# Altium schematic sheet SFP1.SchDoc: SFP1
size A3; Organization: Altium Limited; Address1: L3, 12a Rodborough Rd; Address2: Frenchs Forest; Address3: NSW; Address4: Australia 2086
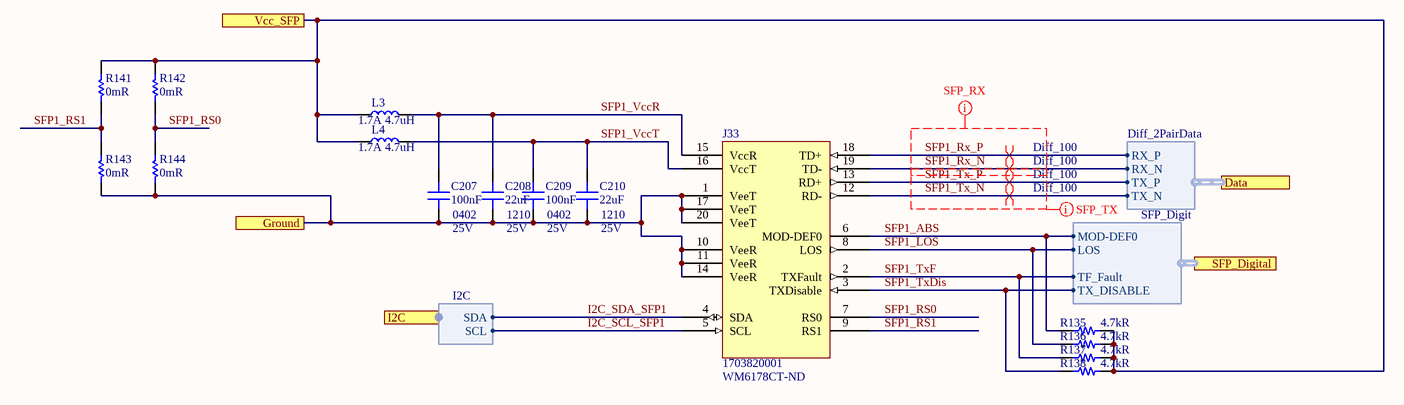
[diagram p0: SFP1.SchDoc]

## Parts
C207  100nF  Case/Package: 0402  Voltage Rating: 25V  [CAP 0402/1005 KK]
C208  22uF  Case/Package: 1210  Voltage Rating: 25V  [CAP 1210/3225 - 1MM]
C209  100nF  Case/Package: 0402  Voltage Rating: 25V  [CAP 0402/1005 KK]
C210  22uF  Case/Package: 1210  Voltage Rating: 25V  [CAP 1210/3225 - 1MM]
J33  1703820001  Supplier Part Number 1: WM6178CT-ND  [1703820001]
L3  Inductance: 4.7uH  Current Rating: 1.7A  [NRS8040]  (hidden comment: NRS4018T4R7MDGJV)
L4  Inductance: 4.7uH  Current Rating: 1.7A  [NRS8040]  (hidden comment: NRS4018T4R7MDGJV)
R135  4.7kR  [RES 0402/1005 RF KK]
R136  4.7kR  [RES 0402/1005 RF KK]
R137  4.7kR  [RES 0402/1005 RF KK]
R138  4.7kR  [RES 0402/1005 RF KK]
R141  0mR  [RES 0402/1005 RF KK]
R142  0mR  [RES 0402/1005 RF KK]
R143  0mR  [RES 0402/1005 RF KK]
R144  0mR  [RES 0402/1005 RF KK]

## Ports
Data (harness Diff_2PairData), Ground, I2C (harness I2C), SFP_Digital (harness SFP_Digit), Vcc_SFP

## Harnesses
I2C: SDA, SCL
SFP_Digit: MOD-DEF0, LOS, TF_Fault, TX_DISABLE
Diff_2PairData: RX_P, RX_N, TX_P, TX_N

## Nets
Ground: C207.1 C208.2 C209.1 C210.2 J33.1(VeeT) J33.10(VeeR) J33.11(VeeR) J33.14(VeeR) J33.17(VeeT) J33.20(VeeT) R143.2 R144.2 ; port Ground
I2C_SCL_SFP1: J33.5(SCL) ; port I2C.SCL
I2C_SDA_SFP1: J33.4(SDA) ; port I2C.SDA
SFP1_ABS: J33.6(MOD-DEF0) R135.1 ; port SFP_Digital.MOD-DEF0
SFP1_LOS: J33.8(LOS) R136.1 ; port SFP_Digital.LOS
SFP1_RS0: J33.7(RS0) R142.2 R144.1
SFP1_RS1: J33.9(RS1) R141.2 R143.1
SFP1_Rx_N: J33.19(TD-) ; port Data.RX_N
SFP1_Rx_P: J33.18(TD+) ; port Data.RX_P
SFP1_Tx_N: J33.12(RD-) ; port Data.TX_N
SFP1_Tx_P: J33.13(RD+) ; port Data.TX_P
SFP1_TxDis: J33.3(TXDisable) R138.1 ; port SFP_Digital.TX_DISABLE
SFP1_TxF: J33.2(TXFault) R137.1 ; port SFP_Digital.TF_Fault
SFP1_VccR: C207.2 C208.1 J33.15(VccR) L3.2
SFP1_VccT: C209.2 C210.1 J33.16(VccT) L4.2
Vcc_SFP: L3.1 L4.1 R135.2 R136.2 R137.2 R138.2 R141.1 R142.1 ; port Vcc_SFP

## Layout directives
differential pair; differential pair class Diff_100: SFP1_Rx_N, SFP1_Rx_P, SFP1_Tx_N, SFP1_Tx_P
net class SFP_RX: SFP1_Rx_N, SFP1_Rx_P
net class SFP_TX: SFP1_Rx_N, SFP1_Tx_N, SFP1_Tx_P

## Notes on the sheet
- Title
- Size:
- Date:
- A3
- Number:
- Time:
- Revision:
- Sheet
- of
- File:

## Library data of the parts
C207 C209 = Capacitor: Manufacturer: Murata; Manufacturer Part Number: GRM155R71E104KE14J; Tolerance: 10%; Dielectric: X7R; Supplier 1: Digi-Key; Supplier Part Number 1: 490-14603-1-ND; Stock 1: 89275; Pricing 1: 1 = 0,10000, 10 = 0,03400, 100 = 0,01520, 500 = 0,01088, 1000 = 0,00855, 2500 = 0,00778, 5000 = 0,00715 (USD); RoHS: Yes; Mount: Surface Mount; Weight: 0.000212oz; Case Code (Imperial): 0402; Case Code (Metric): 1005; Min Operating Temperature: -55°C; Max Operating Temperature: 125°C; Packaging: Tape and Reel; Capacitance: 100nF; Termination: SMD/SMT; Composition: Ceramic; Voltage Rating (DC): 25V; Package Quantity: 50000; Length: 0.039inch; Height: 0.5mm; Width: 0.5mm; Thickness: 0.022inch; ComponentLink1URL: http://www.mouser.com/ds/2/281/c02e-2905.pdf?src-supplier=Mouser; ComponentLink1Description: http://www.mouser.com/ds/2/281/c02e-2905.pdf?src-supplier=Mouser; ComponentLink2URL: http://search.murata.co.jp/Ceramy/image/img/A01X/G101/ENG/GRM155R71E104KE14-01.pdf?src-supplier=Digi-Key; ComponentLink2Description: http://search.murata.co.jp/Ceramy/image/img/A01X/G101/ENG/GRM155R71E104KE14-01.pdf?src-supplier=Digi-Key
C208 C210 = Capacitor: Manufacturer: Samsung; Manufacturer Part Number: CL32A226KAJNNNE; Material: Ceramic; Tolerance: 10%; Dielectric: X5R; Supplier 1: Digi-Key; Supplier Part Number 1: 1276-1101-1-ND; Stock 1: 46396; Pricing 1: 1 = 0,51000, 10 = 0,36300, 100 = 0,23920, 500 = 0,17722 (USD); RoHS: Yes; Mount: Surface Mount; Case Code (Metric): 3225; Case Code (Imperial): 1210; Contact Plating: Tin; Min Operating Temperature: -55°C; Max Operating Temperature: 85°C; Capacitance: 22uF; Packaging: Tape and Reel; Package Quantity: 1; Voltage: 25V; Length: 3.2mm; Height: 2.5mm; Width: 0.098inch; Thickness: 0.106inch; Depth: 2.5mm; Radiation Hardening: No; ComponentLink1URL: https://datasheet.ciiva.com/26947/getdatasheetpartid-358377-26947025.pdf?src-supplier=Verical; ComponentLink1Description: https://datasheet.ciiva.com/26947/getdatasheetpartid-358377-26947025.pdf?src-supplier=Verical; ComponentLink2URL: https://datasheet.ciiva.com/16202/cl32a226kajnnne-16202745.pdf?src-supplier=Future+Electronics; ComponentLink2Description: https://datasheet.ciiva.com/16202/cl32a226kajnnne-16202745.pdf?src-supplier=Future+Electronics; ComponentLink3URL: https://datasheet.ciiva.com/29241/450711-da-01-en-vs-kondensator-1210-29241799.pdf?src-supplier=Conrad; ComponentLink3Description: https://datasheet.ciiva.com/29241/450711-da-01-en-vs-kondensator-1210-29241799.pdf?src-supplier=Conrad
J33 = 1703820001: Conn zSFP+ F 20 POS 0.8mm Solder RA SMD 20 Terminal 1 Port zSFP+™ Reel; Manufacturer: Molex; Number of Circuits: 20; Connector Type: Receptacle; Number of Ports: 1; Max Voltage Rating (AC): 120V; Gender: Female; Current Rating: 500mA; Supplier 1: Digi-Key; Manufacturer Part Number: 1703820001; RoHS: Yes; Category: Connectors; Stock 1: 248; Pricing 1: 1=2,23000, 10=2,02500, 25=1,90080, 50=1,81820, 100=1,73550 (USD); Mount: Surface Mount; Material: Brass; Contact Plating: Gold; Contact Material: Bronze,Brass,Copper Alloy; Housing Material: Polycarbonate; Housing Color: Black; Min Operating Temperature: -40°C; Max Operating Temperature: 85°C; Number of Positions: 20; Termination: Solder; Number of Positions Loaded: 20; Package Quantity: 960; Number of Contacts: 20; Packaging: Tape and Reel; Max Voltage Rating (DC): 120V; Voltage Rating (AC): 120V; Orientation: Right Angle; Length: 11mm; Pitch: 0.8mm; Depth: 7.87mm; Radiation Hardening: No; REACH SVHC: No SVHC; Halogen Free: Low Halogen; ELV: Compliant; Flammability Rating: UL94 V-0; ComponentLink1URL: https://datasheet.ciiva.com/3966/317371703820001-io-nectors-3966818.pdf?src-supplier=Arrow; ComponentLink1Description: https://datasheet.ciiva.com/3966/317371703820001-io-nectors-3966818.pdf?src-supplier=Arrow; ComponentLink2URL: https://datasheet.ciiva.com/26288/495951703820001-io-nectors-26288395.pdf?src-supplier=Onlinecomponents.com; ComponentLink2Description: https://datasheet.ciiva.com/26288/495951703820001-io-nectors-26288395.pdf?src-supplier=Onlinecomponents.com; ComponentLink3URL: https://datasheet.ciiva.com/26945/getdatasheetpartid-750999-26945324.pdf?src-supplier=Verical; ComponentLink3Description: https://datasheet.ciiva.com/26945/getdatasheetpartid-750999-26945324.pdf?src-supplier=Verical; ComponentLink4URL: https://datasheet.ciiva.com/16077/629941703820001-io-nectors-16077135.pdf?src-supplier=Onlinecomponents.com; ComponentLink4Description: https://datasheet.ciiva.com/16077/629941703820001-io-nectors-16077135.pdf?src-supplier=Onlinecomponents.com; ComponentLink5URL: https://datasheet.ciiva.com/6929/1703820001-sd-6929267.pdf?src-supplier=Digi-Key; ComponentLink5Description: https://datasheet.ciiva.com/6929/1703820001-sd-6929267.pdf?src-supplier=Digi-Key; ComponentLink6URL: https://datasheet.ciiva.com/26915/getdatasheetpartid-410263-26915957.pdf?src-supplier=Verical; ComponentLink6Description: https://datasheet.ciiva.com/26915/getdatasheetpartid-410263-26915957.pdf?src-supplier=Verical; ComponentLink7URL: https://datasheet.ciiva.com/3138/1703820001-io-connectors-3138921.pdf?src-supplier=Avnet; ComponentLink7Description: https://datasheet.ciiva.com/3138/1703820001-io-connectors-3138921.pdf?src-supplier=Avnet; ComponentLink8URL: https://datasheet.ciiva.com/3138/1703820001-io-connectors-3138922.pdf?src-supplier=Avnet; ComponentLink8Description: https://datasheet.ciiva.com/3138/1703820001-io-connectors-3138922.pdf?src-supplier=Avnet; ComponentLink9URL: https://datasheet.ciiva.com/4569/1703820001-io-connectors-230609-4569597.pdf?src-supplier=Mouser; ComponentLink9Description: https://datasheet.ciiva.com/4569/1703820001-io-connectors-230609-4569597.pdf?src-supplier=Mouser
L3 L4 = NRS4018T4R7MDGJV: Ind Power Shielded Wirewound 4.7uH 20% 100KHz Ferrite 1.7A Embossed T/R; Manufacturer: Taiyo Yuden; Saturation Current: 2A; DC Resistance (DCR): 84mR; Self Resonant Frequency: 35MHz; Supplier 1: Digi-Key; Manufacturer Part Number: NRS4018T4R7MDGJV; RoHS: Yes; Category: Fixed Inductors; Stock 1: 1620; Pricing 1: 1=0,41000, 10=0,35700, 100=0,25500, 500=0,21422, 1000=0,17342 (USD); Mount: Surface Mount; Case/Package: Nonstandard; Weight: 0.003527oz; Core Material: Ferrite; Min Operating Temperature: -40°C; Max Operating Temperature: 125°C; Packaging: Tape and Reel; Tolerance: 20%; Package Quantity: 3500; Shielding: Shielded; Composition: Wirewound; Test Frequency: 100kHz; Max DC Current: 1.7A; Termination: SMD/SMT; Length: 4mm; Height: 1.8mm; Width: 0.157inch; Height - Seated (Max): 0.071inch; Depth: 4mm; Ratings: AEC-Q200; Radiation Hardening: No; Halogen Free: Halogen Free; ComponentLink1URL: https://datasheet.ciiva.com/29697/nrs4018t4r7mdgjv-ss-29697589.pdf?src-supplier=Digi-Key; ComponentLink1Description: https://datasheet.ciiva.com/29697/nrs4018t4r7mdgjv-ss-29697589.pdf?src-supplier=Digi-Key; Supplier Part Number 1: 587-3578-1-ND
R135-R138 = Resistor: Manufacturer: Panasonic; Manufacturer Part Number: ERJ-2RKF4701X; Tolerance: 1%; Temperature Coefficient: 100ppm/°C; Power Rating: 100mW; Voltage Rating: 50V; Supplier 1: Digi-Key; Supplier Part Number 1: P4.70KLCT-ND; Stock 1: 5361977; Pricing 1: 1 = 0,10000, 10 = 0,05500, 100 = 0,02250, 1000 = 0,01009, 2500 = 0,00876, 5000 = 0,00724 (USD); RoHS: Yes; Mount: Surface Mount; Case/Package: 0402; Number of Pins: 2; Case Code (Imperial): 0402; Case Code (Metric): 1005; Contact Plating: Tin; Min Operating Temperature: -55°C; Max Operating Temperature: 155°C; Resistance: 4.7kR; Packaging: Tape and Reel; Composition: Thick Film; Package Quantity: 1; Termination: SMD/SMT; Voltage Rating (DC): 50V; Number of Terminations: 2; Military Standard: Not; Max Power Dissipation: 100mW; Features: Automotive AEC-Q200; Length: 1mm; Height: 0.35mm; Width: 0.02inch; Depth: 0.5mm; Radiation Hardening: No; Lead Free: Lead Free; REACH SVHC: No SVHC; ComponentLink1URL: https://datasheet.ciiva.com/11821/0900766b80f80784-11821329.pdf?src-supplier=RSComponents; ComponentLink1Description: https://datasheet.ciiva.com/11821/0900766b80f80784-11821329.pdf?src-supplier=RSComponents; ComponentLink2URL: https://datasheet.ciiva.com/30053/aoa0000ce2-30053990.pdf?src-supplier=Onlinecomponents.com; ComponentLink2Description: https://datasheet.ciiva.com/30053/aoa0000ce2-30053990.pdf?src-supplier=Onlinecomponents.com; ComponentLink3URL: https://datasheet.ciiva.com/7830/aoa0000ce2-7830727.pdf?src-supplier=Element14; ComponentLink3Description: https://datasheet.ciiva.com/7830/aoa0000ce2-7830727.pdf?src-supplier=Element14; ComponentLink4URL: https://datasheet.ciiva.com/22781/1678782-22781576.pdf?src-supplier=Farnell; ComponentLink4Description: https://datasheet.ciiva.com/22781/1678782-22781576.pdf?src-supplier=Farnell; ComponentLink5URL: https://datasheet.ciiva.com/9195/aoa0000ce2-9195737.pdf?src-supplier=Avnet; ComponentLink5Description: https://datasheet.ciiva.com/9195/aoa0000ce2-9195737.pdf?src-supplier=Avnet; ComponentLink6URL: https://datasheet.ciiva.com/17213/aoa0000ce2-17213180.pdf?src-supplier=Avnet+Europe; ComponentLink6Description: https://datasheet.ciiva.com/17213/aoa0000ce2-17213180.pdf?src-supplier=Avnet+Europe; ComponentLink7URL: https://datasheet.ciiva.com/22667/1678782-22667886.pdf?src-supplier=Element14; ComponentLink7Description: https://datasheet.ciiva.com/22667/1678782-22667886.pdf?src-supplier=Element14; ComponentLink8URL: https://datasheet.ciiva.com/16763/70260748-16763151.pdf?src-supplier=Allied+Electronics; ComponentLink8Description: https://datasheet.ciiva.com/16763/70260748-16763151.pdf?src-supplier=Allied+Electronics; ComponentLink9URL: https://datasheet.ciiva.com/22723/1678782-22723903.pdf?src-supplier=Element14; ComponentLink9Description: https://datasheet.ciiva.com/22723/1678782-22723903.pdf?src-supplier=Element14; ComponentLink10URL: https://datasheet.ciiva.com/24025/aoa0000ce2-24025663.pdf?src-supplier=Mouser; ComponentLink10Description: https://datasheet.ciiva.com/24025/aoa0000ce2-24025663.pdf?src-supplier=Mouser
R141-R144 = Resistor: Manufacturer 1: Yageo; Manufacturer Part Number 1: RC0402JR-070RL; Power Rating: 62.5mW; Tolerance: 5%; Voltage Rating: 50V; Max Power Dissipation: 63mW; Temperature Coefficient: 200ppm/°C; Supplier 1: Digi-Key; Supplier Part Number 1: 311-0.0JRCT-ND; Stock 1: 69822252; Pricing 1: 1=0.10000, 10=0.01200, 25=0.00920, 50=0.00680, 100=0.00510, 250=0.00388, 500=0.00308, 1000=0.00227, 5000=0.00163 (USD); RoHS: Yes; Case/Package: 0402; Contact Plating: Tin,Matte; Case Code (Metric): 1005; Case Code (Imperial): 0402; Min Operating Temperature: -55°C; Max Operating Temperature: 155°C; Resistance: 0mR; Packaging: Tape and Reel; Composition: Thick Film; Package Quantity: 1; Number of Terminations: 2; Termination: SMD/SMT; Military Standard: Not; Features: Moisture Resistant; Length: 1mm; Height: 0.016inch; Width: 0.02inch; Depth: 0.5mm; Radiation Hardening: No; REACH SVHC: Unknown; Lead Free: Lead Free; ComponentLink1URL: https://datasheet.ciiva.com/2452/pyu-rc0402-51-rohs-l-6-2452608.pdf?src-supplier=Digi-Key; ComponentLink1Description: https://datasheet.ciiva.com/2452/pyu-rc0402-51-rohs-l-6-2452608.pdf?src-supplier=Digi-Key; ComponentLink2URL: https://datasheet.ciiva.com/11808/0900766b80c66297-11808195.pdf?src-supplier=RSComponents; ComponentLink2Description: https://datasheet.ciiva.com/11808/0900766b80c66297-11808195.pdf?src-supplier=RSComponents; ComponentLink3URL: https://datasheet.ciiva.com/2452/pyu-r-int-thick-7-2452609.pdf?src-supplier=Digi-Key; ComponentLink3Description: https://datasheet.ciiva.com/2452/pyu-r-int-thick-7-2452609.pdf?src-supplier=Digi-Key; ComponentLink4URL: https://datasheet.ciiva.com/22747/1018594-22747515.pdf?src-supplier=Element14; ComponentLink4Description: https://datasheet.ciiva.com/22747/1018594-22747515.pdf?src-supplier=Element14; ComponentLink5URL: https://datasheet.ciiva.com/7983/1018594-7983535.pdf?src-supplier=Element14; ComponentLink5Description: https://datasheet.ciiva.com/7983/1018594-7983535.pdf?src-supplier=Element14; ComponentLink6URL: https://datasheet.ciiva.com/2452/pyu-r-int-thick-7-2452610.pdf?src-supplier=Digi-Key; ComponentLink6Description: https://datasheet.ciiva.com/2452/pyu-r-int-thick-7-2452610.pdf?src-supplier=Digi-Key; ComponentLink7URL: https://datasheet.ciiva.com/8896/pyu-rc0402-51-rohs-l-6-8896201.pdf?src-supplier=Avnet; ComponentLink7Description: https://datasheet.ciiva.com/8896/pyu-rc0402-51-rohs-l-6-8896201.pdf?src-supplier=Avnet; ComponentLink8URL: https://datasheet.ciiva.com/28386/pyu-rc0402-51-rohs-l-6-28386633.pdf?src-supplier=Avnet+Europe; ComponentLink8Description: https://datasheet.ciiva.com/28386/pyu-rc0402-51-rohs-l-6-28386633.pdf?src-supplier=Avnet+Europe; ComponentLink9URL: https://datasheet.ciiva.com/15189/getdatasheetpartid-326379-15189533.pdf?src-supplier=Verical; ComponentLink9Description: https://datasheet.ciiva.com/15189/getdatasheetpartid-326379-15189533.pdf?src-supplier=Verical